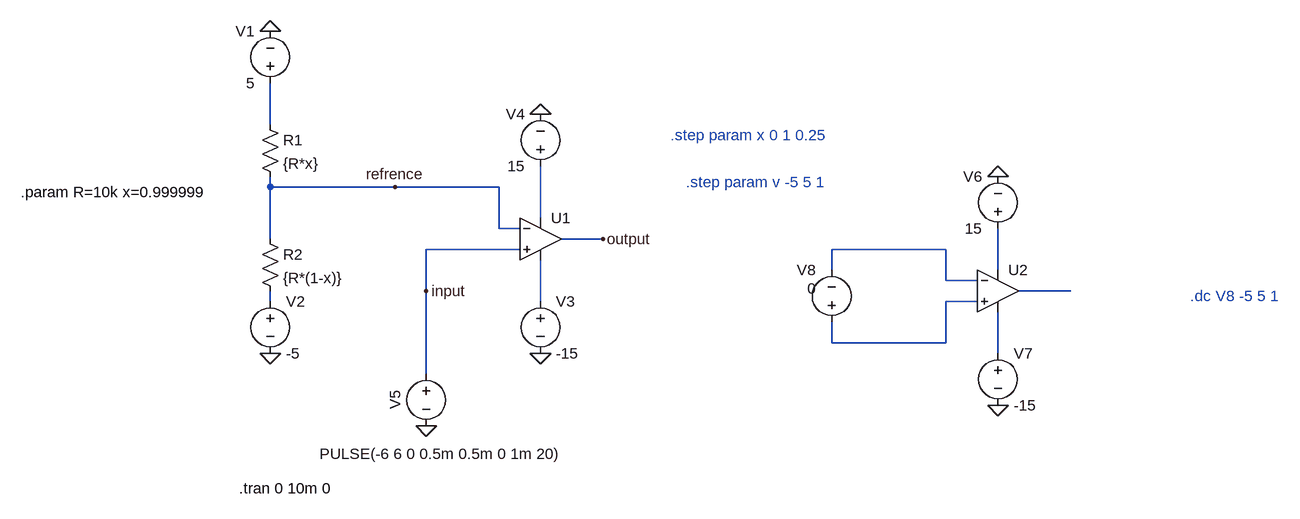
[diagram p0: schematic E2.asc]
E2.asc, the LTspice schematic file:
Version 4.1
SHEET 1 1372 680
WIRE -192 0 -192 -64
WIRE -192 96 -192 80
WIRE 0 96 -192 96
WIRE 160 96 0 96
WIRE 224 144 224 64
WIRE 160 160 160 96
WIRE 192 160 160 160
WIRE -192 176 -192 96
WIRE 320 176 256 176
WIRE 192 192 48 192
WIRE 848 192 672 192
WIRE 672 224 672 192
WIRE 928 224 928 160
WIRE 848 240 848 192
WIRE 896 240 848 240
WIRE 48 256 48 192
WIRE 1040 256 960 256
WIRE -192 272 -192 256
WIRE 224 272 224 208
WIRE 896 272 848 272
WIRE 672 336 672 304
WIRE 848 336 848 272
WIRE 848 336 672 336
WIRE 928 352 928 288
WIRE 48 384 48 256
FLAG -192 -144 0
FLAG -192 352 0
FLAG 224 352 0
FLAG 224 -16 0
FLAG 48 464 0
FLAG 928 80 0
FLAG 928 432 0
FLAG 0 96 refrence
FLAG 48 256 input
FLAG 320 176 output
SYMBOL OpAmps\\UniversalOpAmp2 224 176 R0
SYMATTR InstName U1
SYMBOL res -208 -16 R0
SYMATTR InstName R1
SYMATTR Value {R*x}
SYMBOL voltage -192 -48 R180
WINDOW 0 24 96 Left 2
WINDOW 3 24 16 Left 2
WINDOW 123 0 0 Left 0
WINDOW 39 0 0 Left 0
SYMATTR InstName V1
SYMATTR Value 5
SYMBOL voltage -192 256 R0
WINDOW 123 0 0 Left 0
WINDOW 39 0 0 Left 0
SYMATTR InstName V2
SYMATTR Value -5
SYMBOL voltage 224 256 R0
WINDOW 123 0 0 Left 0
WINDOW 39 0 0 Left 0
SYMATTR InstName V3
SYMATTR Value -15
SYMBOL voltage 224 80 R180
WINDOW 0 24 96 Left 2
WINDOW 3 24 16 Left 2
WINDOW 123 0 0 Left 0
WINDOW 39 0 0 Left 0
SYMATTR InstName V4
SYMATTR Value 15
SYMBOL voltage 48 368 R0
WINDOW 0 -32 56 VBottom 2
WINDOW 3 22 123 Top 2
WINDOW 123 0 0 Left 0
WINDOW 39 0 0 Left 0
SYMATTR InstName V5
SYMATTR Value PULSE(-6 6 0 0.5m 0.5m 0 1m 20)
SYMBOL res -208 160 R0
SYMATTR InstName R2
SYMATTR Value {R*(1-x)}
SYMBOL OpAmps\\UniversalOpAmp2 928 256 R0
SYMATTR InstName U2
SYMBOL voltage 928 176 R180
WINDOW 0 24 96 Left 2
WINDOW 3 24 16 Left 2
WINDOW 123 0 0 Left 0
WINDOW 39 0 0 Left 0
SYMATTR InstName V6
SYMATTR Value 15
SYMBOL voltage 928 336 R0
WINDOW 123 0 0 Left 0
WINDOW 39 0 0 Left 0
SYMATTR InstName V7
SYMATTR Value -15
SYMBOL voltage 672 320 R180
WINDOW 0 24 96 Left 2
WINDOW 3 24 68 Left 2
WINDOW 123 0 0 Left 0
WINDOW 39 0 0 Left 0
SYMATTR InstName V8
SYMATTR Value 0
TEXT -576 104 Left 2 !.param R=10k x=0.999999
TEXT 424 16 Left 2 ;.step param x 0 1 0.25
TEXT 448 88 Left 2 ;.step param v -5 5 1
TEXT -240 560 Left 2 !.tran 0 10m 0
TEXT 1224 264 Left 2 ;.dc V8 -5 5 1

The netlist it stands for:
* E2.asc
X§U1 input refrence N002 N007 output level2 Avol=1Meg GBW=10Meg Slew=10Meg Ilimit=25m Rail=0 Vos=0 En=0 Enk=0 In=0 Ink=0 Rin=500Meg  ; pins In+ In- V+ V- OUT
R1 N001 refrence {R*x}
V1 N001 0 5
V2 N006 0 -5
V3 N007 0 -15
V4 N002 0 15
V5 input 0 PULSE(-6 6 0 0.5m 0.5m 0 1m 20)
R2 refrence N006 {R*(1-x)}
X§U2 N008 N003 N004 N009 N005 level2 Avol=1Meg GBW=10Meg Slew=10Meg Ilimit=25m Rail=0 Vos=0 En=0 Enk=0 In=0 Ink=0 Rin=500Meg  ; pins In+ In- V+ V- OUT
V6 N004 0 15
V7 N009 0 -15
V8 N008 N003 0
.param R=10k x=0.999999
* .step param x 0 1 0.25
* .step param v -5 5 1
.tran 0 10m 0
* .dc V8 -5 5 1
.lib UniversalOpAmp2.lib
.backanno
.end